# Altium schematic sheet RF_circuit.SchDoc
size A2; SheetNumber: 5; SheetTotal: 6
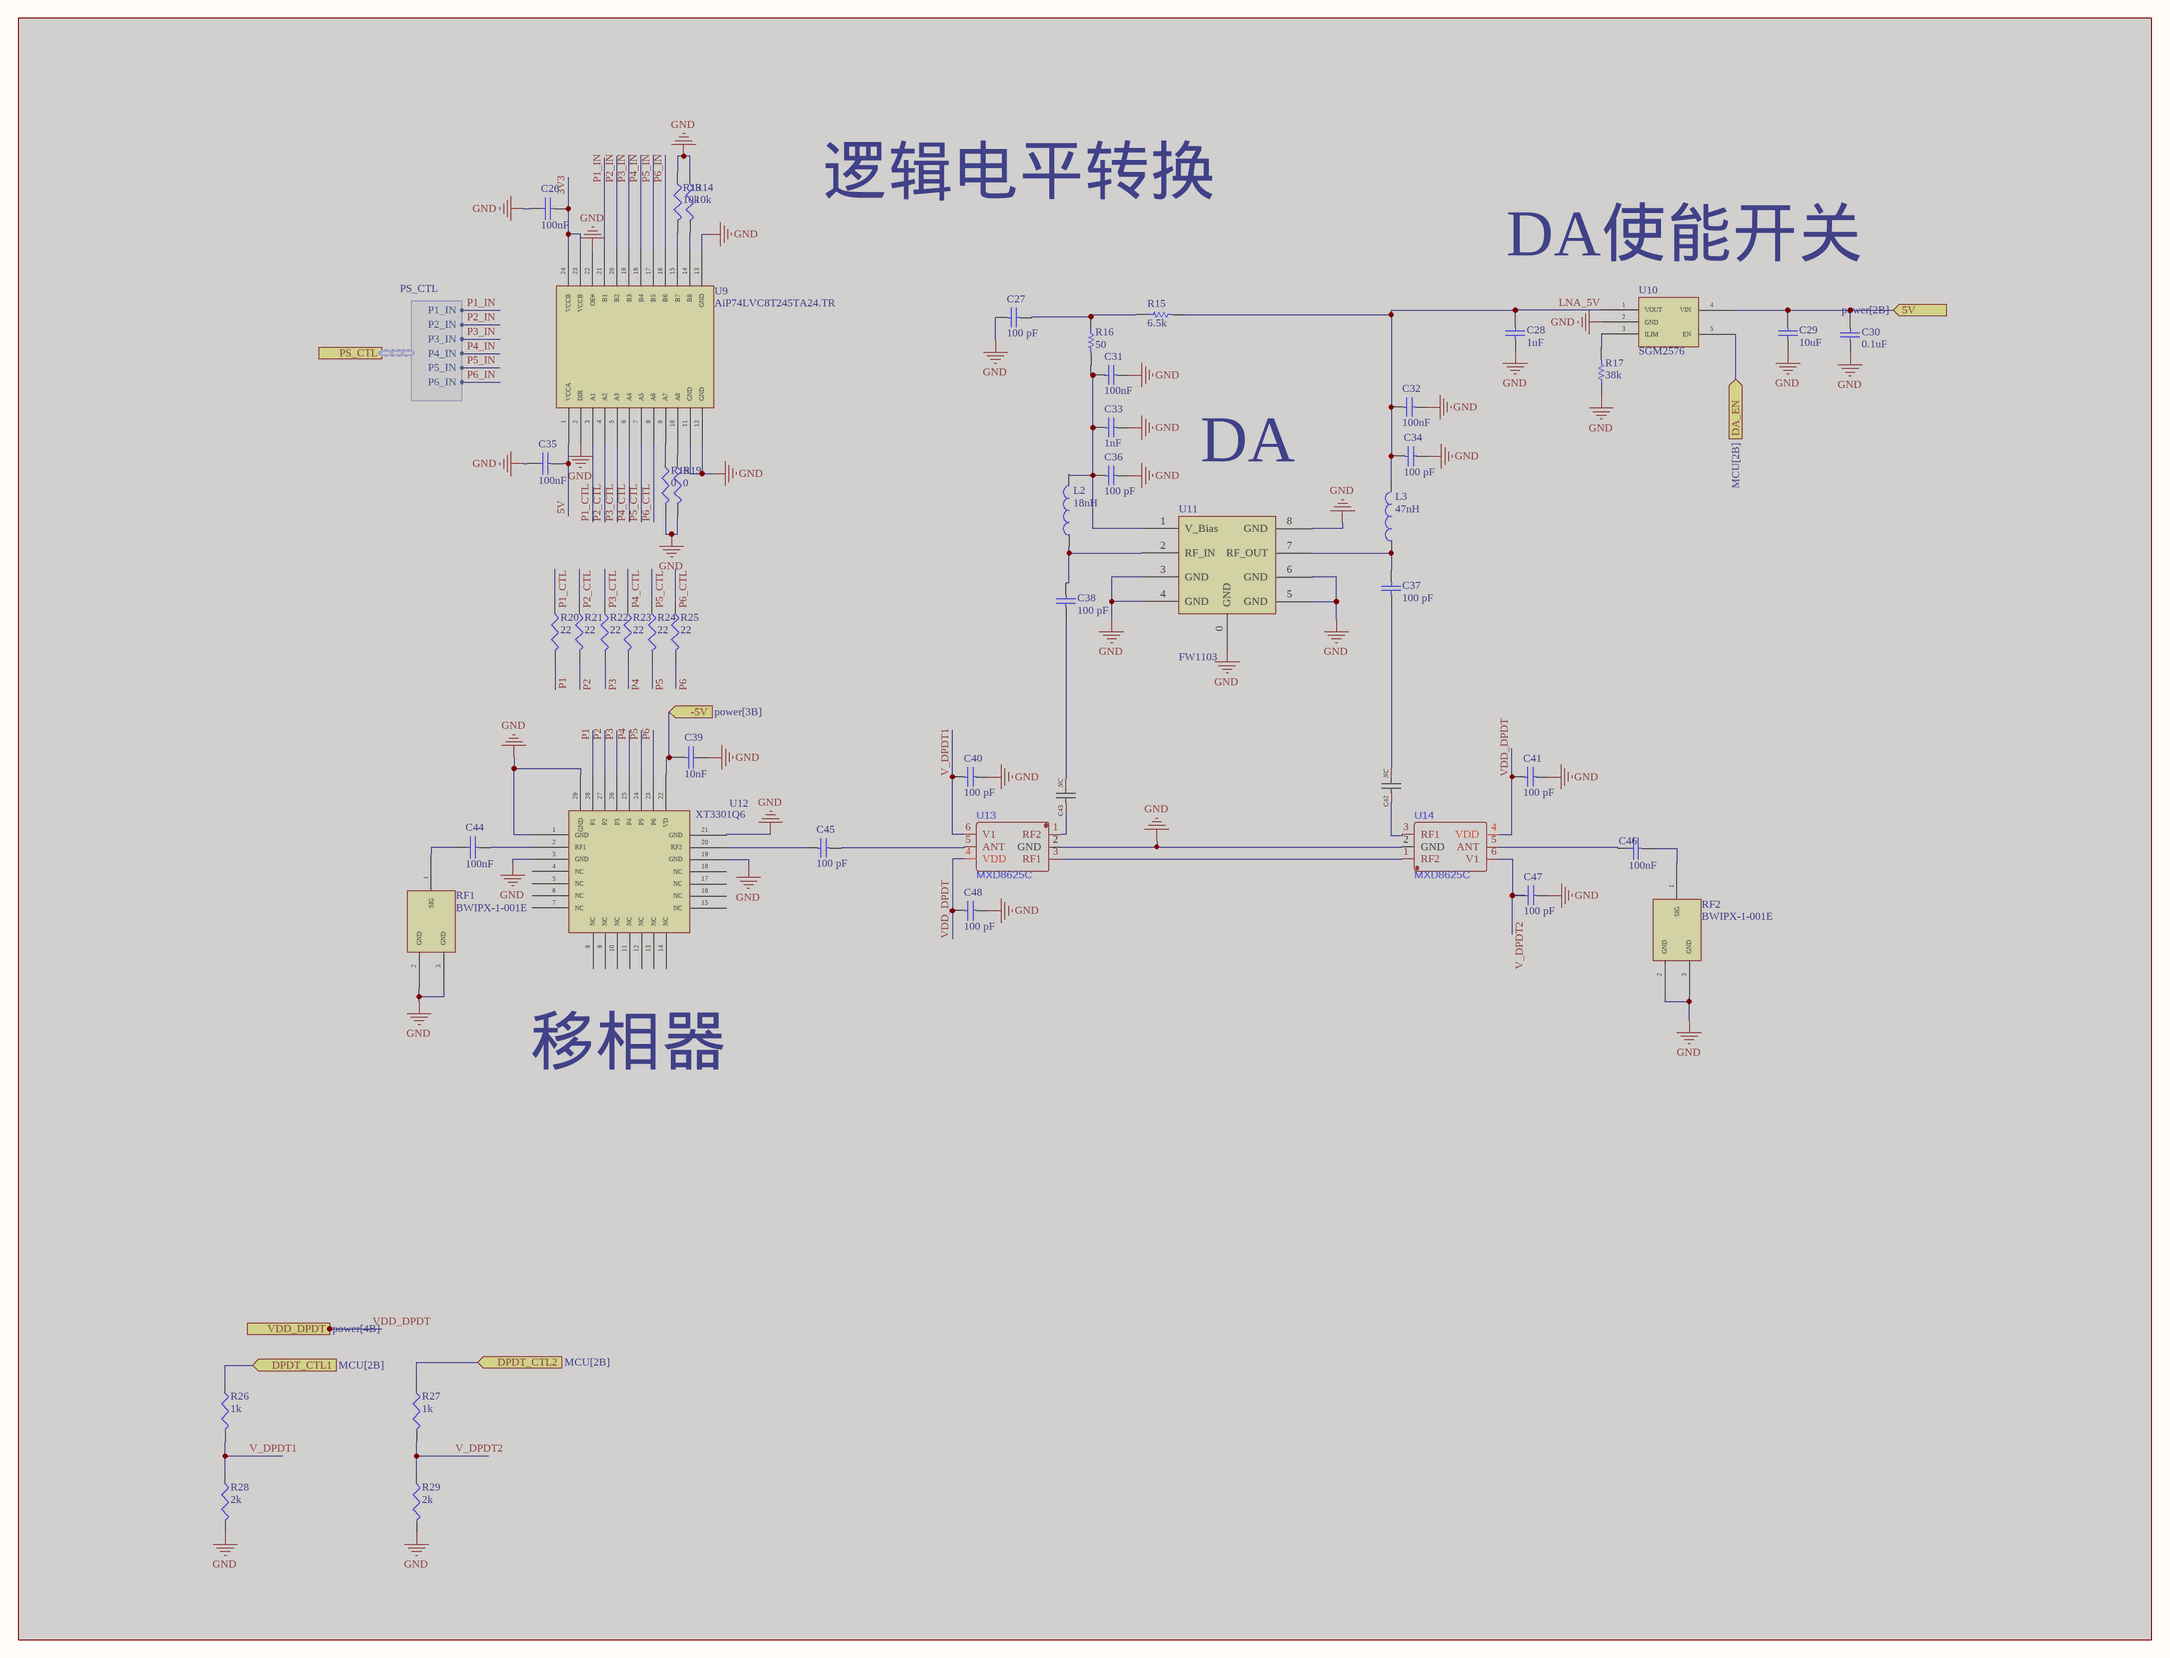
[diagram p0: RF_circuit.SchDoc]

## Parts
C26  100nF  [0402_Z]  (masked out: inside a compile mask, not in the netlist)
C27  100 pF  [0402_Z]  (masked out: inside a compile mask, not in the netlist)
C28  1uF  [0603_Z]  (masked out: inside a compile mask, not in the netlist)
C29  10uF  [0603_Z]  (masked out: inside a compile mask, not in the netlist)
C30  0.1uF  [0402_Z]  (masked out: inside a compile mask, not in the netlist)
C31  100nF  [0402_Z]  (masked out: inside a compile mask, not in the netlist)
C32  100nF  [0402_Z]  (masked out: inside a compile mask, not in the netlist)
C33  1nF  [0402_Z]  (masked out: inside a compile mask, not in the netlist)
C34  100 pF  [0402_Z]  (masked out: inside a compile mask, not in the netlist)
C35  100nF  [0402_Z]  (masked out: inside a compile mask, not in the netlist)
C36  100 pF  [0402_Z]  (masked out: inside a compile mask, not in the netlist)
C37  100 pF  [0402_Z]  (masked out: inside a compile mask, not in the netlist)
C38  100 pF  [0402_Z]  (masked out: inside a compile mask, not in the netlist)
C39  10nF  [0402_Z]  (masked out: inside a compile mask, not in the netlist)
C40  100 pF  [0402_Z]  (masked out: inside a compile mask, not in the netlist)
C41  100 pF  [0402_Z]  (masked out: inside a compile mask, not in the netlist)
C42  NC  [0603_Z]  (no BOM)  (masked out: inside a compile mask, not in the netlist)
C43  NC  [0603_Z]  (no BOM)  (masked out: inside a compile mask, not in the netlist)
C44  100nF  [0603_Z]  (masked out: inside a compile mask, not in the netlist)
C45  100 pF  [0402_Z]  (masked out: inside a compile mask, not in the netlist)
C46  100nF  [0603_Z]  (masked out: inside a compile mask, not in the netlist)
C47  100 pF  [0402_Z]  (masked out: inside a compile mask, not in the netlist)
C48  100 pF  [0402_Z]  (masked out: inside a compile mask, not in the netlist)
L2  18nH  [0402_Z]  (masked out: inside a compile mask, not in the netlist)
L3  47nH  [0402_Z]  (masked out: inside a compile mask, not in the netlist)
R13  10k  [0402_Z]  (masked out: inside a compile mask, not in the netlist)
R14  10k  [0402_Z]  (masked out: inside a compile mask, not in the netlist)
R15  6.5k  [0402_Z]  (masked out: inside a compile mask, not in the netlist)
R16  50  [0402_Z]  (masked out: inside a compile mask, not in the netlist)
R17  38k  [0402_Z]  (masked out: inside a compile mask, not in the netlist)
R18  0  [0402_Z]  (masked out: inside a compile mask, not in the netlist)
R19  0  [0402_Z]  (masked out: inside a compile mask, not in the netlist)
R20  22  [0402_Z]  (masked out: inside a compile mask, not in the netlist)
R21  22  [0402_Z]  (masked out: inside a compile mask, not in the netlist)
R22  22  [0402_Z]  (masked out: inside a compile mask, not in the netlist)
R23  22  [0402_Z]  (masked out: inside a compile mask, not in the netlist)
R24  22  [0402_Z]  (masked out: inside a compile mask, not in the netlist)
R25  22  [0402_Z]  (masked out: inside a compile mask, not in the netlist)
R26  1k  [0402_Z]  (masked out: inside a compile mask, not in the netlist)
R27  1k  [0402_Z]  (masked out: inside a compile mask, not in the netlist)
R28  2k  [0402_Z]  (masked out: inside a compile mask, not in the netlist)
R29  2k  [0402_Z]  (masked out: inside a compile mask, not in the netlist)
RF1  BWIPX-1-001E  [SMA-SMD_BWSMA-KE-P001]  (masked out: inside a compile mask, not in the netlist)
RF2  BWIPX-1-001E  [SMA-SMD_BWSMA-KE-P001]  (masked out: inside a compile mask, not in the netlist)
U9  AiP74LVC8T245TA24.TR  [AIP74LVC8T245TA24.TR]  (masked out: inside a compile mask, not in the netlist)
U10  SGM2576  [SGM2576]  (masked out: inside a compile mask, not in the netlist)
U11  FW1103  [FW1103W]  (masked out: inside a compile mask, not in the netlist)
U12  XT3301Q6  [XT3301Q6]  (masked out: inside a compile mask, not in the netlist)
U13  MXD8625C  [MXD8625C]  (masked out: inside a compile mask, not in the netlist)
U14  MXD8625C  [MXD8625C]  (masked out: inside a compile mask, not in the netlist)

## Ports
5V (in, see power[2B]), -5V (in, see power[3B]), DA_EN (in, see MCU[2B]), DPDT_CTL1 (in, see MCU[2B]), DPDT_CTL2 (in, see MCU[2B]), PS_CTL (harness PS_CTL, see MCU[4B]), VDD_DPDT (in, see power[4B])

## Harnesses
PS_CTL: P1_IN, P2_IN, P3_IN, P4_IN, P5_IN, P6_IN

## Notes on the sheet
- 逻辑电平转换
- DA使能开关
- DA
- 移相器

## Library data of the parts
C26 C35 C39 C44 C46 = CAP: 0402; Value: 20pF  NP0
C27-C34 C36-C38 C40 C41 C45 C47 C48 = Cap: Capacitor; Value: 100pF; Published: 8-Jun-2000; LatestRevisionDate: 17-Jul-2002; LatestRevisionNote: Re-released for DXP Platform.; PackageReference: RAD-0.3; Publisher: Altium Limited; PackageDescription: Radial Cap, Thru-Hole; 2 Leads; 0.3 in Pin Spacing
C42 C43 = Cap_NC
L2 L3 = Inductor: Code_IEC: 1005; Value: 10mH; Published: 8-Jun-2000; LatestRevisionDate: 29-May-2009; LatestRevisionNote: IPC-7351 Footprint Added.; PackageReference: 0402-A; Publisher: Altium Limited; PackageDescription: Chip Inductor; Code_JEITA: 0402
R13 R14 R18-R29 = Res3: Resistor; Published: 8-Jun-2000; LatestRevisionDate: 04-Mar-2005; LatestRevisionNote: PCB Footprint replaced.; PackageReference: J1-0603; Publisher: Altium Limited
  R13 R14: Value: 10k
  R18 R19: Value: 0
  R20-R25: Value: 22
  R26 R27: Value: 1k
  R28 R29: Value: 2k
R15-R17 = Res1: Resistor; Value: 1K; Published: 8-Jun-2000; LatestRevisionDate: 17-Jul-2002; LatestRevisionNote: Re-released for DXP Platform.; PackageReference: AXIAL-0.3; Publisher: Altium Limited; PackageDescription: Axial Device, Thru-Hole; 2 Leads; 0.3 in Pin Spacing
U9 = AiP74LVC8T245TA24.TR: 具有三态输出的8位双电源转换收发器，可实现双向电平转换